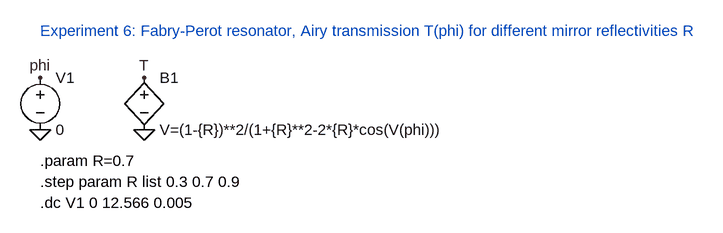
[diagram p0: schematic FabryPerot_Airy_Transmission.asc]
FabryPerot_Airy_Transmission.asc, the LTspice schematic file:
Version 4.1
SHEET 1 800 400
FLAG 80 176 0
FLAG 80 96 phi
FLAG 240 176 0
FLAG 240 96 T
SYMBOL voltage 80 80 R0
SYMATTR InstName V1
SYMATTR Value 0
SYMBOL bv 240 80 R0
SYMATTR InstName B1
SYMATTR Value V=(1-{R})**2/(1+{R}**2-2*{R}*cos(V(phi)))
TEXT 80 24 Left 2 ;Experiment 6: Fabry-Perot resonator, Airy transmission T(phi) for different mirror reflectivities R
TEXT 80 224 Left 2 !.param R=0.7
TEXT 80 256 Left 2 !.step param R list 0.3 0.7 0.9
TEXT 80 288 Left 2 !.dc V1 0 12.566 0.005

The netlist it stands for:
* FabryPerot_Airy_Transmission.asc
V1 phi 0 0
B1 T 0 V=(1-{R})**2/(1+{R}**2-2*{R}*cos(V(phi)))
* Experiment 6: Fabry-Perot resonator, Airy transmission T(phi) for different mirror reflectivities R
.param R=0.7
.step param R list 0.3 0.7 0.9
.dc V1 0 12.566 0.005
.backanno
.end